# Altium project Main_Board.PrjPcb (part 28 of 44)

## Sheet Power_Ethernet.SchDoc
size A3
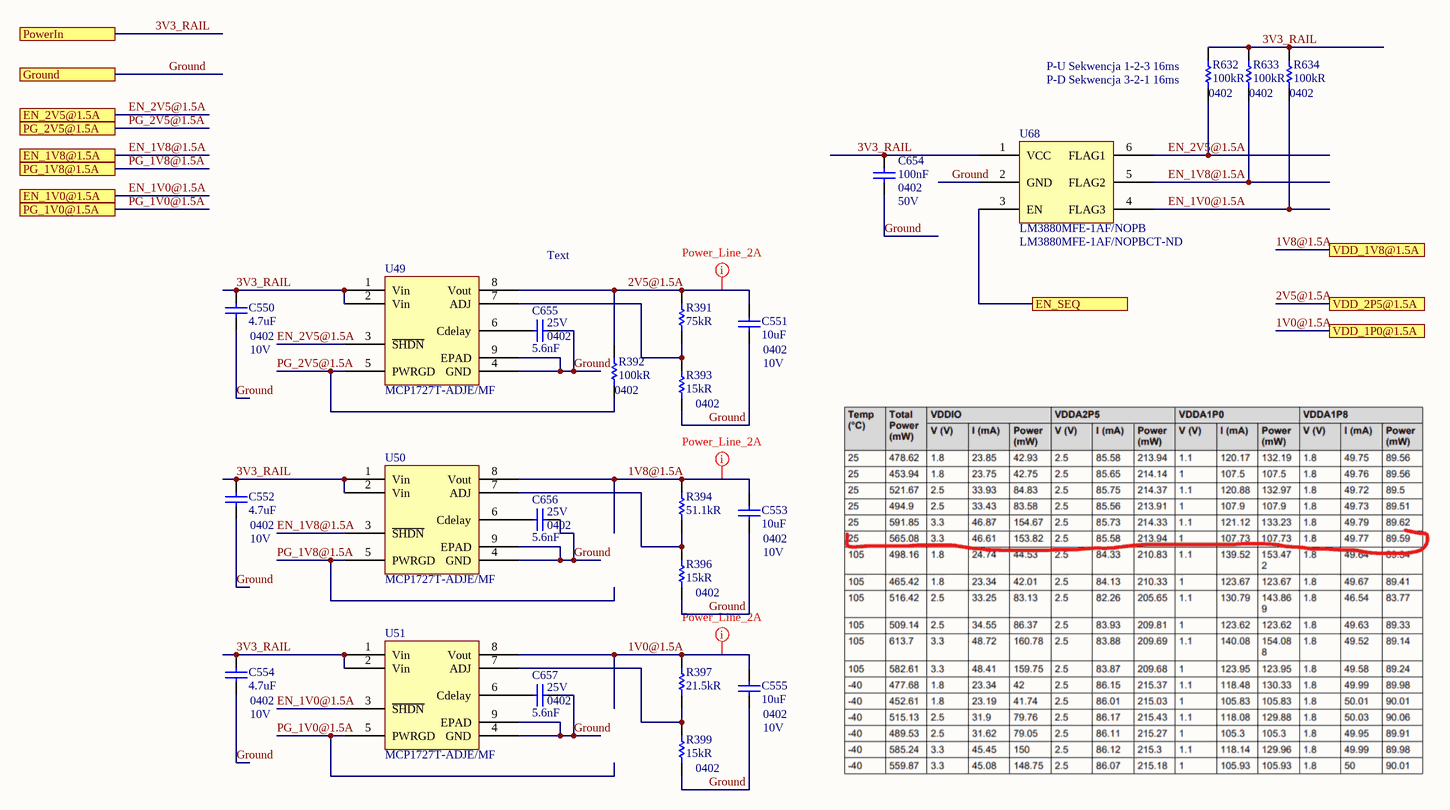
[diagram p39: Power_Ethernet.SchDoc]

### Parts
C550  4.7uF  Case/Package: 0402  Voltage Rating: 10V  [CAP 0402/1005 KK]
C551  10uF  Case/Package: 0402  Voltage Rating: 10V  [CAP 0402/1005 KK]
C552  4.7uF  Case/Package: 0402  Voltage Rating: 10V  [CAP 0402/1005 KK]
C553  10uF  Case/Package: 0402  Voltage Rating: 10V  [CAP 0402/1005 KK]
C554  4.7uF  Case/Package: 0402  Voltage Rating: 10V  [CAP 0402/1005 KK]
C555  10uF  Case/Package: 0402  Voltage Rating: 10V  [CAP 0402/1005 KK]
C654  Case/Package: 0402  Voltage Rating: 50V  [CAP 0402/1005 KK]  (hidden comment: 100nF)
C655  5.6nF  Case/Package: 0402  Voltage Rating: 25V  [CAP 0402/1005 KK]
C656  5.6nF  Case/Package: 0402  Voltage Rating: 25V  [CAP 0402/1005 KK]
C657  5.6nF  Case/Package: 0402  Voltage Rating: 25V  [CAP 0402/1005 KK]
R391  75kR  [RES 0402/1005 RF KK]
R392  100kR  Case/Package: 0402  [RES 0402/1005 RF KK]
R393  15kR  Case Code (Imperial): 0402  [RES 0402/1005 RF KK]
R394  51.1kR  [RES 0402/1005 RF KK]
R396  15kR  Case Code (Imperial): 0402  [RES 0402/1005 RF KK]
R397  21.5kR  [RES 0402/1005 RF KK]
R399  15kR  Case Code (Imperial): 0402  [RES 0402/1005 RF KK]
R632  100kR  Case/Package: 0402  [RES 0402/1005 RF KK]
R633  100kR  Case/Package: 0402  [RES 0402/1005 RF KK]
R634  100kR  Case/Package: 0402  [RES 0402/1005 RF KK]
U49  MCP1727T-ADJE/MF  [MCP1727T-ADJE/MF]
U50  MCP1727T-ADJE/MF  [MCP1727T-ADJE/MF]
U51  MCP1727T-ADJE/MF  [MCP1727T-ADJE/MF]
U68  LM3880MFE-1AF/NOPB  Supplier Part Number 1: LM3880MFE-1AF/NOPBCT-ND  [LM3880-Q1]

### Ports
EN_1V0@1.5A, EN_1V8@1.5A, EN_2V5@1.5A, EN_SEQ, Ground, PG_1V0@1.5A, PG_1V8@1.5A, PG_2V5@1.5A, PowerIn, VDD_1P0@1.5A, VDD_1V8@1.5A, VDD_2P5@1.5A

### Nets
Ground: C550.1 C551.1 C552.1 C553.1 C554.1 C555.1 C654.1 C655.2 C656.2 C657.2 R393.1 R396.1 R399.1 U49.4(GND) U49.9(EPAD) U50.4(GND) U50.9(EPAD) U51.4(GND) U51.9(EPAD) U68.2(GND) ; port Ground  [project net B503_Ground]
1V0@1.5A: C555.2 R397.2 U51.8(Vout) ; port VDD_1P0@1.5A
1V8@1.5A: C553.2 R394.2 U50.8(Vout) ; port VDD_1V8@1.5A
2V5@1.5A: C551.2 R391.2 R392.2 U49.8(Vout) ; port VDD_2P5@1.5A
3V3_RAIL: C550.2 C552.2 C554.2 C654.2 R632.2 R633.2 R634.2 U49.1(Vin) U49.2(Vin) U50.1(Vin) U50.2(Vin) U51.1(Vin) U51.2(Vin) U68.1(VCC) ; port PowerIn
EN_1V0@1.5A: R634.1 U51.3(~{SHDN}) U68.4(FLAG3) ; port EN_1V0@1.5A
EN_1V8@1.5A: R633.1 U50.3(~{SHDN}) U68.5(FLAG2) ; port EN_1V8@1.5A
EN_2V5@1.5A: R632.1 U49.3(~{SHDN}) U68.6(FLAG1) ; port EN_2V5@1.5A
ETH_VDDIO: U68.3(EN) ; port EN_SEQ
PG_1V0@1.5A: U51.5(PWRGD) ; port PG_1V0@1.5A  [project net GPIOa_00.GPIO5]
PG_1V8@1.5A: U50.5(PWRGD) ; port PG_1V8@1.5A  [project net GPIOa_00.GPIO6]
PG_2V5@1.5A: R392.1 U49.5(PWRGD) ; port PG_2V5@1.5A
NetC655_1: C655.1 U49.6(Cdelay)
NetC656_1: C656.1 U50.6(Cdelay)
NetC657_1: C657.1 U51.6(Cdelay)
NetR391_1: R391.1 R393.2 U49.7(ADJ)
NetR394_1: R394.1 R396.2 U50.7(ADJ)
NetR397_1: R397.1 R399.2 U51.7(ADJ)

### Layout directives
net class Power_Line_2A: 1V0@1.5A, 1V8@1.5A, 2V5@1.5A

### Notes on the sheet
- (near R632) P-U Sekwencja 1-2-3 16ms
- (near R632) P-D Sekwencja 3-2-1 16ms
- Text
- Title
- Size:
- Date:
- A3
- Number:
- Time:
- Revision:
- Sheet
- of
- File:

### Library data of the parts
C550 C552 C554 = Capacitor: as C223 on sheet RAM_Power; Supplier 1: Digi-Key; Supplier Part Number 1: 490-14306-1-ND; Category: Ceramic Capacitors; Stock 1: 980102; Pricing 1: 1=0,23000, 10=0,15400, 100=0,07780, 500=0,05322, 1000=0,04708, 2500=0,04504, 5000=0,04094 (USD); Mount: Surface Mount; Case Code (Imperial): 0402; Case Code (Metric): 1005; Min Operating Temperature: -55°C; Max Operating Temperature: 85°C; Packaging: Tape and Reel; Capacitance: 4.7uF; Tolerance: 20%; ComponentLink1URL: http://www.farnell.com/datasheets/2189109.pdf?src-supplier=Farnell; ComponentLink1Description: http://www.farnell.com/datasheets/2189109.pdf?src-supplier=Farnell; ComponentLink2URL: https://search.murata.co.jp/Ceramy/image/img/A01X/G101/ENG/GRM155R61A475MEAA-01.pdf?src-supplier=Digi-Key; ComponentLink2Description: https://search.murata.co.jp/Ceramy/image/img/A01X/G101/ENG/GRM155R61A475MEAA-01.pdf?src-supplier=Digi-Key; ComponentLink3URL: http://datasheet.octopart.com/GRM155R61A475MEAAD-Murata-datasheet-68589269.pdf?src-supplier=Newark; ComponentLink3Description: http://datasheet.octopart.com/GRM155R61A475MEAAD-Murata-datasheet-68589269.pdf?src-supplier=Newark; ComponentLink4URL: http://datasheet.octopart.com/GRM155R61A475MEAAD-Murata-datasheet-8819587.pdf; ComponentLink4Description: http://datasheet.octopart.com/GRM155R61A475MEAAD-Murata-datasheet-8819587.pdf; ComponentLink5URL: http://datasheet.octopart.com/GRM155R61A475MEAAD-Murata-datasheet-10025737.pdf; ComponentLink5Description: http://datasheet.octopart.com/GRM155R61A475MEAAD-Murata-datasheet-10025737.pdf; ComponentLink6URL: http://datasheet.octopart.com/GRM155R61A475MEAAD-Murata-datasheet-11978611.pdf; ComponentLink6Description: http://datasheet.octopart.com/GRM155R61A475MEAAD-Murata-datasheet-11978611.pdf; ComponentLink7URL: http://datasheet.octopart.com/GRM155R61A475MEAAD-Murata-datasheet-12510076.pdf; ComponentLink7Description: http://datasheet.octopart.com/GRM155R61A475MEAAD-Murata-datasheet-12510076.pdf; ComponentLink8URL: http://datasheet.octopart.com/GRM155R61A475MEAAD-Murata-datasheet-12515295.pdf; ComponentLink8Description: http://datasheet.octopart.com/GRM155R61A475MEAAD-Murata-datasheet-12515295.pdf
C551 C553 C555 = Capacitor: CAP CER 10UF 10V X5R 0402; Manufacturer: Samsung; Manufacturer Part Number: CL05A106MP8NUB8; Tolerance: 20%; Supplier 1: Digi-Key; Supplier Part Number 1: 1276-6830-1-ND; RoHS: Yes; Category: Ceramic Capacitors; Stock 1: 996737; Pricing 1: 1=0,47000, 10=0,32400, 100=0,19410, 500=0,14558, 1000=0,12293, 2500=0,11646 (USD); Mount: Surface Mount; Case Code (Metric): 1005; Case Code (Imperial): 0402; Min Operating Temperature: -55°C; Max Operating Temperature: 85°C; Packaging: Tape and Reel; Capacitance: 10uF; Length: 0.039inch; Width: 0.02inch; Thickness: 0.035inch; ComponentLink1URL: http://www.samsungsem.com/kr/support/product-search/mlcc/CL05A106MP8NUB8.jsp?src-supplier=Digi-Key; ComponentLink1Description: http://www.samsungsem.com/kr/support/product-search/mlcc/CL05A106MP8NUB8.jsp?src-supplier=Digi-Key
C654 = Capacitor: as C219-C222 on sheet RAM_Power; Supplier 1: Digi-Key; Supplier Part Number 1: 490-10697-1-ND; RoHS: Yes; Category: Ceramic Capacitors; Stock 1: 435607; Pricing 1: 1=0,10000, 10=0,04600, 100=0,02050, 500=0,01464, 1000=0,01150, 2500=0,01045, 5000=0,00961 (USD); Mount: Surface Mount; Weight: 0.000212oz; Case Code (Metric): 1005; Case Code (Imperial): 0402; Min Operating Temperature: -55°C; Max Operating Temperature: 85°C; Capacitance: 100nF; Packaging: Tape and Reel; Voltage: 50V; Dielectric: X5R; Termination: SMD/SMT; Composition: Ceramic; Voltage Rating (DC): 50V; Package Quantity: 10000; Length: 1mm; Height: 0.5mm; Width: 0.02inch; Thickness: 0.022inch; Depth: 0.5mm; REACH SVHC: No SVHC; Lead Free: Lead Free; ComponentLink1URL: http://www.farnell.com/datasheets/2079150.pdf?src-supplier=Farnell; ComponentLink1Description: http://www.farnell.com/datasheets/2079150.pdf?src-supplier=Farnell; ComponentLink2URL: http://www.mouser.com/ds/2/281/c02e-2905.pdf?src-supplier=Mouser; ComponentLink2Description: http://www.mouser.com/ds/2/281/c02e-2905.pdf?src-supplier=Mouser; ComponentLink3URL: http://www.farnell.com/datasheets/2079150.pdf?src-supplier=Element14; ComponentLink3Description: http://www.farnell.com/datasheets/2079150.pdf?src-supplier=Element14; ComponentLink4URL: http://search.murata.co.jp/Ceramy/image/img/A01X/G101/ENG/GRM155R61H104KE14-01.pdf?src-supplier=Digi-Key; ComponentLink4Description: http://search.murata.co.jp/Ceramy/image/img/A01X/G101/ENG/GRM155R61H104KE14-01.pdf?src-supplier=Digi-Key
C655-C657 = Capacitor: Manufacturer: Yageo; Manufacturer Part Number: CC0402KRX7R8BB562; Tolerance: 10%; Dielectric: X7R; Supplier 1: Digi-Key; Supplier Part Number 1: 311-1718-1-ND; Stock 1: 37070; Pricing 1: 1 = 0,10000, 10 = 0,03600, 100 = 0,01620, 500 = 0,01156, 1000 = 0,00908, 2500 = 0,00825, 5000 = 0,00759 (USD); RoHS: Yes; Mount: Surface Mount; Number of Pins: 2; Weight: 2.3E-05oz; Case Code (Imperial): 0402; Case Code (Metric): 1005; Min Operating Temperature: -55°C; Max Operating Temperature: 125°C; Capacitance: 5.6nF; Packaging: Tape and Reel; Voltage Rating (DC): 25V; Termination: SMD/SMT; Composition: Ceramic; Length: 0.039inch; Width: 0.02inch; Thickness: 0.022inch; Depth: 0.5mm; Lead Free: Lead Free; Halogen Free: Halogen Free; ComponentLink1URL: https://datasheet.ciiva.com/13264/upy-gphc-x7r-6-3v-to-50v-8-12304-13264955.pdf?src-supplier=Mouser; ComponentLink1Description: https://datasheet.ciiva.com/13264/upy-gphc-x7r-6-3v-to-50v-8-12304-13264955.pdf?src-supplier=Mouser
R391 = Resistor: RES SMD 75K OHM 1% 1/16W 0402; Manufacturer: Yageo; Manufacturer Part Number: RC0402FR-0775KL; Power Rating: 62.5mW; Voltage Rating: 50V; Temperature Coefficient: 100ppm/°C; Max Power Dissipation: 63mW; Supplier 1: Digi-Key; Supplier Part Number 1: 311-75KLRCT-ND; RoHS: Yes; Category: Chip SMD Resistors; Stock 1: 526252; Pricing 1: 1=0,10000, 10=0,01600, 100=0,00640, 1000=0,00289, 2500=0,00251, 5000=0,00207 (USD); Case/Package: 0402; Case Code (Metric): 1005; Case Code (Imperial): 0402; Min Operating Temperature: -55°C; Max Operating Temperature: 155°C; Resistance: 75kR; Tolerance: 1%; Packaging: Tape and Reel; Package Quantity: 1; Composition: Thick Film; Number of Terminations: 2; Termination: SMD/SMT; Military Standard: Not; Voltage Rating (DC): 50V; Features: Moisture Resistant; Length: 1mm; Height: 0.016inch; Width: 0.02inch; Depth: 0.5mm; REACH SVHC: No SVHC; Lead Free: Lead Free; ComponentLink1URL: https://datasheet.ciiva.com/11808/0900766b80c66297-11808837.pdf?src-supplier=RSComponents; ComponentLink1Description: https://datasheet.ciiva.com/11808/0900766b80c66297-11808837.pdf?src-supplier=RSComponents; ComponentLink2URL: https://datasheet.ciiva.com/2553/pyu-r-int-thick-7-2553239.pdf?src-supplier=Digi-Key; ComponentLink2Description: https://datasheet.ciiva.com/2553/pyu-r-int-thick-7-2553239.pdf?src-supplier=Digi-Key; ComponentLink3URL: https://datasheet.ciiva.com/16744/pyu-rc0402-51-rohs-l-6-r-16744999.pdf?src-supplier=Future+Electronics; ComponentLink3Description: https://datasheet.ciiva.com/16744/pyu-rc0402-51-rohs-l-6-r-16744999.pdf?src-supplier=Future+Electronics; ComponentLink4URL: https://datasheet.ciiva.com/2553/pyu-r-int-thick-7-2553240.pdf?src-supplier=Digi-Key; ComponentLink4Description: https://datasheet.ciiva.com/2553/pyu-r-int-thick-7-2553240.pdf?src-supplier=Digi-Key; ComponentLink5URL: https://datasheet.ciiva.com/2553/pyu-r-int-thick-7-2553241.pdf?src-supplier=Digi-Key; ComponentLink5Description: https://datasheet.ciiva.com/2553/pyu-r-int-thick-7-2553241.pdf?src-supplier=Digi-Key; ComponentLink6URL: https://datasheet.ciiva.com/7850/1018594-7850091.pdf?src-supplier=Element14; ComponentLink6Description: https://datasheet.ciiva.com/7850/1018594-7850091.pdf?src-supplier=Element14; ComponentLink7URL: https://datasheet.ciiva.com/12666/pyu-rc0402-51-rohs-l-6-r-12666987.pdf?src-supplier=Mouser; ComponentLink7Description: https://datasheet.ciiva.com/12666/pyu-rc0402-51-rohs-l-6-r-12666987.pdf?src-supplier=Mouser; ComponentLink8URL: https://datasheet.ciiva.com/7850/1018594-7850092.pdf?src-supplier=Element14; ComponentLink8Description: https://datasheet.ciiva.com/7850/1018594-7850092.pdf?src-supplier=Element14
R392 R632-R634 = Resistor: Manufacturer 1: Panasonic; Manufacturer Part Number 1: ERA-2AED104X; Tolerance: 0.5%; Power Rating: 63mW; Voltage Rating: 25V; Temperature Coefficient: 25ppm/°C; Supplier 1: Digi-Key; Supplier Part Number 1: P100KDECT-ND; Stock 1: 54338; Pricing 1: 1=0.22000, 10=0.18800, 100=0.07350, 1000=0.03077, 2500=0.02820, 5000=0.02564 (USD); RoHS: Yes; Mount: Surface Mount; Case Code (Imperial): 0402; Case Code (Metric): 1005; Contact Plating: Tin; Min Operating Temperature: -55°C; Max Operating Temperature: 155°C; Resistance: 100kR; Packaging: Tape and Reel; Package Quantity: 10000; Composition: Metal Film,Thin Film; Number of Terminations: 2; Military Standard: Not; Termination: SMD/SMT; Max Power Dissipation: 63mW; Voltage Rating (DC): 25V; Length: 1mm; Height: 0.016inch; Width: 0.5mm; Depth: 0.5mm; Radiation Hardening: No; REACH SVHC: No SVHC; Lead Free: Lead Free; ComponentLink1URL: https://datasheet.ciiva.com/24028/aoa0000ce26-197354-24028150.pdf?src-supplier=Mouser; ComponentLink1Description: https://datasheet.ciiva.com/24028/aoa0000ce26-197354-24028150.pdf?src-supplier=Mouser; ComponentLink2URL: https://datasheet.ciiva.com/43470/1776116-43470438.pdf?src-supplier=Farnell; ComponentLink2Description: https://datasheet.ciiva.com/43470/1776116-43470438.pdf?src-supplier=Farnell; ComponentLink3URL: https://datasheet.ciiva.com/7830/1776116-7830920.pdf?src-supplier=Element14; ComponentLink3Description: https://datasheet.ciiva.com/7830/1776116-7830920.pdf?src-supplier=Element14; ComponentLink4URL: https://datasheet.ciiva.com/46378/1776116-46378234.pdf?src-supplier=Element14; ComponentLink4Description: https://datasheet.ciiva.com/46378/1776116-46378234.pdf?src-supplier=Element14; ComponentLink5URL: https://datasheet.ciiva.com/16780/70068849-16780139.pdf?src-supplier=Allied+Electronics; ComponentLink5Description: https://datasheet.ciiva.com/16780/70068849-16780139.pdf?src-supplier=Allied+Electronics; ComponentLink6URL: https://datasheet.ciiva.com/9117/aoa0000ce26-9117229.pdf?src-supplier=Avnet; ComponentLink6Description: https://datasheet.ciiva.com/9117/aoa0000ce26-9117229.pdf?src-supplier=Avnet; ComponentLink7URL: https://datasheet.ciiva.com/16511/aoa0000ce26-16511566.pdf?src-supplier=Avnet+Asia; ComponentLink7Description: https://datasheet.ciiva.com/16511/aoa0000ce26-16511566.pdf?src-supplier=Avnet+Asia; ComponentLink8URL: https://datasheet.ciiva.com/30225/54aoa0000ce26-30225311.pdf?src-supplier=Onlinecomponents.com; ComponentLink8Description: https://datasheet.ciiva.com/30225/54aoa0000ce26-30225311.pdf?src-supplier=Onlinecomponents.com
R393 R396 R399 = Resistor: Manufacturer: Panasonic; Manufacturer Part Number: ERJ-2RKF1502X; Tolerance: 1%; Voltage Rating: 50V; Power Rating: 100mW; Temperature Coefficient: 100ppm/°C; Supplier 1: Digi-Key; Supplier Part Number 1: P15.0KLDKR-ND; Stock 1: 3339464; Pricing 1: 1 = 0,10000, 10 = 0,04100, 100 = 0,01670, 1000 = 0,00751, 2500 = 0,00652, 5000 = 0,00538 (USD); RoHS: Yes; Mount: Surface Mount; Case/Package: 0402; Number of Pins: 2; Weight: 2.8E-05oz; Case Code (Metric): 1005; Contact Plating: Tin; Min Operating Temperature: -55°C; Max Operating Temperature: 155°C; Resistance: 15kR; Packaging: Tape and Reel; Package Quantity: 1; Composition: Thick Film; Termination: SMD/SMT; Number of Terminations: 2; Military Standard: Not; Max Power Dissipation: 100mW; Voltage Rating (DC): 50V; Features: Automotive AEC-Q200; Length: 1mm; Height: 0.35mm; Width: 0.5mm; Depth: 0.5mm; Radiation Hardening: No; REACH SVHC: No SVHC; Lead Free: Lead Free; ComponentLink1URL: https://datasheet.ciiva.com/11821/0900766b80f80784-11821181.pdf?src-supplier=RSComponents; ComponentLink1Description: https://datasheet.ciiva.com/11821/0900766b80f80784-11821181.pdf?src-supplier=RSComponents; ComponentLink2URL: https://datasheet.ciiva.com/16778/70260748-16778682.pdf?src-supplier=Allied+Electronics; ComponentLink2Description: https://datasheet.ciiva.com/16778/70260748-16778682.pdf?src-supplier=Allied+Electronics; ComponentLink3URL: https://datasheet.ciiva.com/46372/1678782-46372862.pdf?src-supplier=Element14; ComponentLink3Description: https://datasheet.ciiva.com/46372/1678782-46372862.pdf?src-supplier=Element14; ComponentLink4URL: https://datasheet.ciiva.com/17211/aoa0000ce2-17211535.pdf?src-supplier=Avnet+Europe; ComponentLink4Description: https://datasheet.ciiva.com/17211/aoa0000ce2-17211535.pdf?src-supplier=Avnet+Europe; ComponentLink5URL: https://datasheet.ciiva.com/46372/1678782-46372863.pdf?src-supplier=Element14; ComponentLink5Description: https://datasheet.ciiva.com/46372/1678782-46372863.pdf?src-supplier=Element14; ComponentLink6URL: https://datasheet.ciiva.com/6138/aoa0000ce2-6138166.pdf?src-supplier=Farnell; ComponentLink6Description: https://datasheet.ciiva.com/6138/aoa0000ce2-6138166.pdf?src-supplier=Farnell; ComponentLink7URL: https://datasheet.ciiva.com/16765/70260748-16765542.pdf?src-supplier=Allied+Electronics; ComponentLink7Description: https://datasheet.ciiva.com/16765/70260748-16765542.pdf?src-supplier=Allied+Electronics; ComponentLink8URL: https://datasheet.ciiva.com/43467/1678782-43467414.pdf?src-supplier=Farnell; ComponentLink8Description: https://datasheet.ciiva.com/43467/1678782-43467414.pdf?src-supplier=Farnell; ComponentLink9URL: https://datasheet.ciiva.com/9193/aoa0000ce2-9193047.pdf?src-supplier=Avnet; ComponentLink9Description: https://datasheet.ciiva.com/9193/aoa0000ce2-9193047.pdf?src-supplier=Avnet; ComponentLink10URL: https://datasheet.ciiva.com/8079/426256-8079609.pdf?src-supplier=Element14; ComponentLink10Description: https://datasheet.ciiva.com/8079/426256-8079609.pdf?src-supplier=Element14; ComponentLink11URL: https://datasheet.ciiva.com/16371/aoa0000ce2-16371499.pdf?src-supplier=Future+Electronics; ComponentLink11Description: https://datasheet.ciiva.com/16371/aoa0000ce2-16371499.pdf?src-supplier=Future+Electronics; ComponentLink12URL: https://datasheet.ciiva.com/22687/1678782-22687068.pdf?src-supplier=Element14; ComponentLink12Description: https://datasheet.ciiva.com/22687/1678782-22687068.pdf?src-supplier=Element14
R394 = Resistor: RES 51.1K OHM 1% 1/16W 0402; Manufacturer: Stackpole Electronics; Manufacturer Part Number: RMCF0402FT51K1; Power Rating: 63mW; Temperature Coefficient: 100ppm/°C; Supplier 1: Digi-Key; Supplier Part Number 1: RMCF0402FT51K1CT-ND; RoHS: Yes; Category: Chip SMD Resistors; Stock 1: 28421; Pricing 1: 1=0,10000, 10=0,01400, 100=0,00580, 1000=0,00262, 2500=0,00228, 5000=0,00188 (USD); Mount: Surface Mount; Case/Package: 0402; Case Code (Metric): 1005; Case Code (Imperial): 0402; Contact Plating: Tin,Matte; Min Operating Temperature: -55°C; Max Operating Temperature: 155°C; Tolerance: 1%; Packaging: Tape and Reel; Resistance: 51.1kR; Composition: Thick Film; Number of Terminations: 2; Max Power Dissipation: 63mW; Features: Automotive AEC-Q200; Length: 0.039inch; Height: 0.016inch; Width: 0.02inch; Radiation Hardening: No; Lead Free: Lead Free; ComponentLink1URL: http://www.seielect.com/Catalog/SEI-RMC.pdf?src-supplier=Future+Electronics; ComponentLink1Description: http://www.seielect.com/Catalog/SEI-RMC.pdf?src-supplier=Future+Electronics; ComponentLink2URL: https://www.seielect.com/catalog/SEI-Packaging.pdf?src-supplier=Digi-Key; ComponentLink2Description: https://www.seielect.com/catalog/SEI-Packaging.pdf?src-supplier=Digi-Key; ComponentLink3URL: https://www.seielect.com/catalog/SEI-RMCF_RMCP.pdf?src-supplier=Avnet; ComponentLink3Description: https://www.seielect.com/catalog/SEI-RMCF_RMCP.pdf?src-supplier=Avnet; ComponentLink4URL: https://www.seielect.com/Catalog/SEI-RMCF_RMCP.pdf?src-supplier=Digi-Key; ComponentLink4Description: https://www.seielect.com/Catalog/SEI-RMCF_RMCP.pdf?src-supplier=Digi-Key
R397 = Resistor: RES 21.5K OHM 1% 1/16W 0402; Manufacturer: Stackpole Electronics; Manufacturer Part Number: RMCF0402FT21K5; Max Power Dissipation: 63mW; Temperature Coefficient: 100ppm/°C; Supplier 1: Digi-Key; Supplier Part Number 1: RMCF0402FT21K5CT-ND; RoHS: Yes; Category: Chip SMD Resistors; Stock 1: 34545; Pricing 1: 1=0,10000, 10=0,01400, 100=0,00580, 1000=0,00262, 2500=0,00228, 5000=0,00188 (USD); Mount: Surface Mount; Case/Package: 0402; Case Code (Metric): 1005; Case Code (Imperial): 0402; Contact Plating: Tin,Matte; Min Operating Temperature: -55°C; Max Operating Temperature: 155°C; Packaging: Tape and Reel; Resistance: 21.5kR; Tolerance: 1%; Composition: Thick Film; Number of Terminations: 2; Package Quantity: 10000; Features: Automotive AEC-Q200; Length: 0.039inch; Height: 0.016inch; Width: 0.02inch; Radiation Hardening: No; ComponentLink1URL: https://www.seielect.com/Catalog/SEI-RMCF_RMCP.pdf?src-supplier=Digi-Key; ComponentLink1Description: https://www.seielect.com/Catalog/SEI-RMCF_RMCP.pdf?src-supplier=Digi-Key; ComponentLink2URL: https://www.seielect.com/catalog/SEI-Packaging.pdf?src-supplier=Digi-Key; ComponentLink2Description: https://www.seielect.com/catalog/SEI-Packaging.pdf?src-supplier=Digi-Key; ComponentLink3URL: https://www.seielect.com/catalog/SEI-RMCF_RMCP.pdf?src-supplier=Avnet; ComponentLink3Description: https://www.seielect.com/catalog/SEI-RMCF_RMCP.pdf?src-supplier=Avnet; ComponentLink4URL: http://www.seielect.com/Catalog/SEI-RMCF_RMCP.pdf?src-supplier=Digi-Key; ComponentLink4Description: http://www.seielect.com/Catalog/SEI-RMCF_RMCP.pdf?src-supplier=Digi-Key
U49-U51 = MCP1727T-ADJE/MF: IC REG LDO ADJ 1.5A 8DFN; Manufacturer 1: Microchip; Number of Outputs: 1; Min Input Voltage: 2.3V; Max Input Voltage: 6V; Output Voltage: 5V; Dropout Voltage: 330mV; Input Bias Current: 120uA; Reference Voltage: 410mV; Polarity: Positive; Accuracy: 0.5%; Output Type: Adjustable; Supplier 1: Digi-Key; Manufacturer Part Number 1: MCP1727T-ADJE/MF; Stock 1: 9419; Pricing 1: 1=0.84000, 25=0.71080, 100=0.63860 (USD); RoHS: Yes; Mount: Surface Mount; Case/Package: DFN; Contact Plating: Tin,Matte; Min Operating Temperature: -40°C; Max Operating Temperature: 125°C; Package Quantity: 3300; Output Current: 1.5A; Packaging: Tape and Reel; Max Output Current: 1.5A; Quiescent Current: 120uA; Radiation Hardening: No; Lead Free: Lead Free; ComponentLink1URL: https://datasheet.ciiva.com/2057/21999b-2057048.pdf?src-supplier=Digi-Key; ComponentLink1Description: https://datasheet.ciiva.com/2057/21999b-2057048.pdf?src-supplier=Digi-Key; ComponentLink2URL: https://datasheet.ciiva.com/8237/jp027822-8237704.pdf?src-supplier=Avnet; ComponentLink2Description: https://datasheet.ciiva.com/8237/jp027822-8237704.pdf?src-supplier=Avnet; ComponentLink3URL: https://datasheet.ciiva.com/17364/jp027822-17364137.pdf?src-supplier=Avnet+Europe; ComponentLink3Description: https://datasheet.ciiva.com/17364/jp027822-17364137.pdf?src-supplier=Avnet+Europe; Supplier Part Number 1: MCP1727T-ADJE/MFCT-ND
U68 = LM3880MFE-1AF/NOPB: IC PWR SUPPLY SEQUENCER SOT23-6; Manufacturer: TI National Semiconductor; Min Supply Voltage: 2.7V; Max Supply Voltage: 5.5V; Operating Supply Current: 25uA; Number of Voltages Monitored: 3; Overvoltage Threshold: 1.4V; Undervoltage Threshold: 1V; Watchdog Timer: No; Supplier 1: Digi-Key; Manufacturer Part Number: LM3880MFE-1AF/NOPB; Stock 1: 1640; Pricing 1: 1 = 1,55000, 10 = 1,38600, 25 = 1,31520, 100 = 1,00980 (USD); RoHS: Yes; Mount: Surface Mount; Case/Package: SOT-23-6; Number of Pins: 6; Min Operating Temperature: -40°C; Max Operating Temperature: 125°C; Packaging: Tape and Reel; Package Quantity: 250; Quiescent Current: 25uA; Lead Free: Lead Free; ComponentLink1URL: https://datasheet.ciiva.com/14811/snvs451i-14811203.pdf?src-supplier=Arrow; ComponentLink1Description: https://datasheet.ciiva.com/14811/snvs451i-14811203.pdf?src-supplier=Arrow; ComponentLink2URL: https://datasheet.ciiva.com/15105/getdatasheetpartid-633699-15105702.pdf?src-supplier=Verical; ComponentLink2Description: https://datasheet.ciiva.com/15105/getdatasheetpartid-633699-15105702.pdf?src-supplier=Verical; ComponentLink3URL: https://datasheet.ciiva.com/3231/lm3880-3231307.pdf?src-supplier=Avnet; ComponentLink3Description: https://datasheet.ciiva.com/3231/lm3880-3231307.pdf?src-supplier=Avnet; ComponentLink4URL: https://datasheet.ciiva.com/6598/lm3880-6598591.pdf?src-supplier=Digi-Key; ComponentLink4Description: https://datasheet.ciiva.com/6598/lm3880-6598591.pdf?src-supplier=Digi-Key